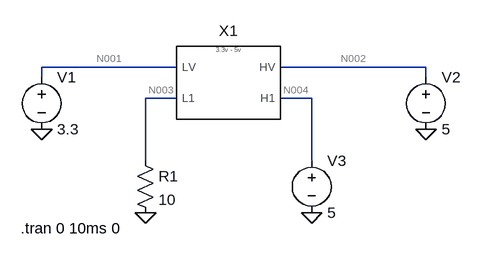
[diagram p0: schematic Level_shift_test.asc]
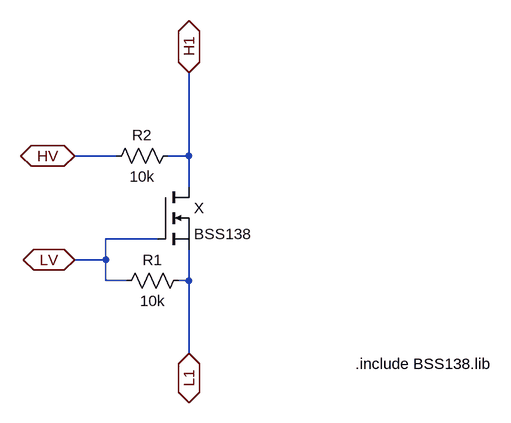
[diagram p1: sub-circuit wwzmdib_level_shifter_one_port.asc]
Level_shift_test.asc, the LTspice schematic file:
Version 4.1
SHEET 1 880 680
WIRE 160 144 -48 144
WIRE 544 144 320 144
WIRE -48 160 -48 144
WIRE 544 160 544 144
WIRE 160 192 112 192
WIRE 368 192 320 192
WIRE 112 288 112 192
WIRE 368 288 368 192
FLAG -48 240 0
FLAG 544 240 0
FLAG 368 368 0
FLAG 112 368 0
SYMBOL WWZMDiB_Level_Shifter_One_Port 240 176 R0
SYMATTR InstName X1
SYMBOL voltage -48 144 R0
SYMATTR InstName V1
SYMATTR Value 3.3
SYMBOL voltage 544 144 R0
SYMATTR InstName V2
SYMATTR Value 5
SYMBOL res 96 272 R0
SYMATTR InstName R1
SYMATTR Value 10
SYMBOL voltage 368 272 R0
SYMATTR InstName V3
SYMATTR Value 5
TEXT -80 392 Left 2 !.tran 0 10ms 0

wwzmdib_level_shifter_one_port.asc, the sub-circuit schematic file:
Version 4.1
SHEET 1 928 680
WIRE 112 32 48 32
WIRE 224 32 224 -96
WIRE 224 32 192 32
WIRE 224 80 224 32
WIRE 176 160 96 160
WIRE 96 192 96 160
WIRE 96 192 48 192
WIRE 96 224 96 192
WIRE 128 224 96 224
WIRE 224 224 224 176
WIRE 224 224 208 224
WIRE 224 336 224 224
FLAG 48 192 LV
IOPIN 48 192 BiDir
FLAG 48 32 HV
IOPIN 48 32 BiDir
FLAG 224 336 L1
IOPIN 224 336 BiDir
FLAG 224 -96 H1
IOPIN 224 -96 BiDir
SYMBOL res 224 208 R90
WINDOW 0 0 56 VBottom 2
WINDOW 3 32 56 VTop 2
SYMATTR InstName R1
SYMATTR Value 10k
SYMBOL res 208 16 R90
WINDOW 0 0 56 VBottom 2
WINDOW 3 32 56 VTop 2
SYMATTR InstName R2
SYMATTR Value 10k
SYMBOL nmos 176 80 R0
SYMATTR InstName X
SYMATTR Value BSS138
TEXT 480 352 Left 2 !.include BSS138.lib

The netlist it stands for:
* Level_shift_test.asc
X§X1 N004 N002 N003 N001 wwzmdib_level_shifter_one_port
V1 N001 0 3.3
V2 N002 0 5
R1 N003 0 10
V3 N004 0 5

* block symbol definitions
.subckt wwzmdib_level_shifter_one_port H1 HV L1 LV
R1 L1 LV 10k
R2 H1 HV 10k
M§X H1 LV L1 L1 BSS138
.include BSS138.lib
.ends wwzmdib_level_shifter_one_port

.model NMOS NMOS
.model PMOS PMOS
.lib standard.mos
.tran 0 10ms 0
.backanno
.end

* Results of the author's LTspice run, read from the files saved beside the schematic
* Operating Point, zero values left out:
*   V(n001) = 3.3 V
*   V(n002) = 5 V
*   V(n003) = 324.8 mV
*   V(n004) = 5 V
*   I(R1) = 32.48 mA
*   I(V1) = -297.5 µA
*   I(V3) = -32.18 mA
*   Ix(x1:h1) = 32.18 mA
*   Ix(x1:l1) = -32.48 mA
*   Ix(x1:lv) = 297.5 µA